# EAGLE design diplomat-modbus (EAGLE 7.7.0)
AUTHOR: Jan Nyman; REVISION: A
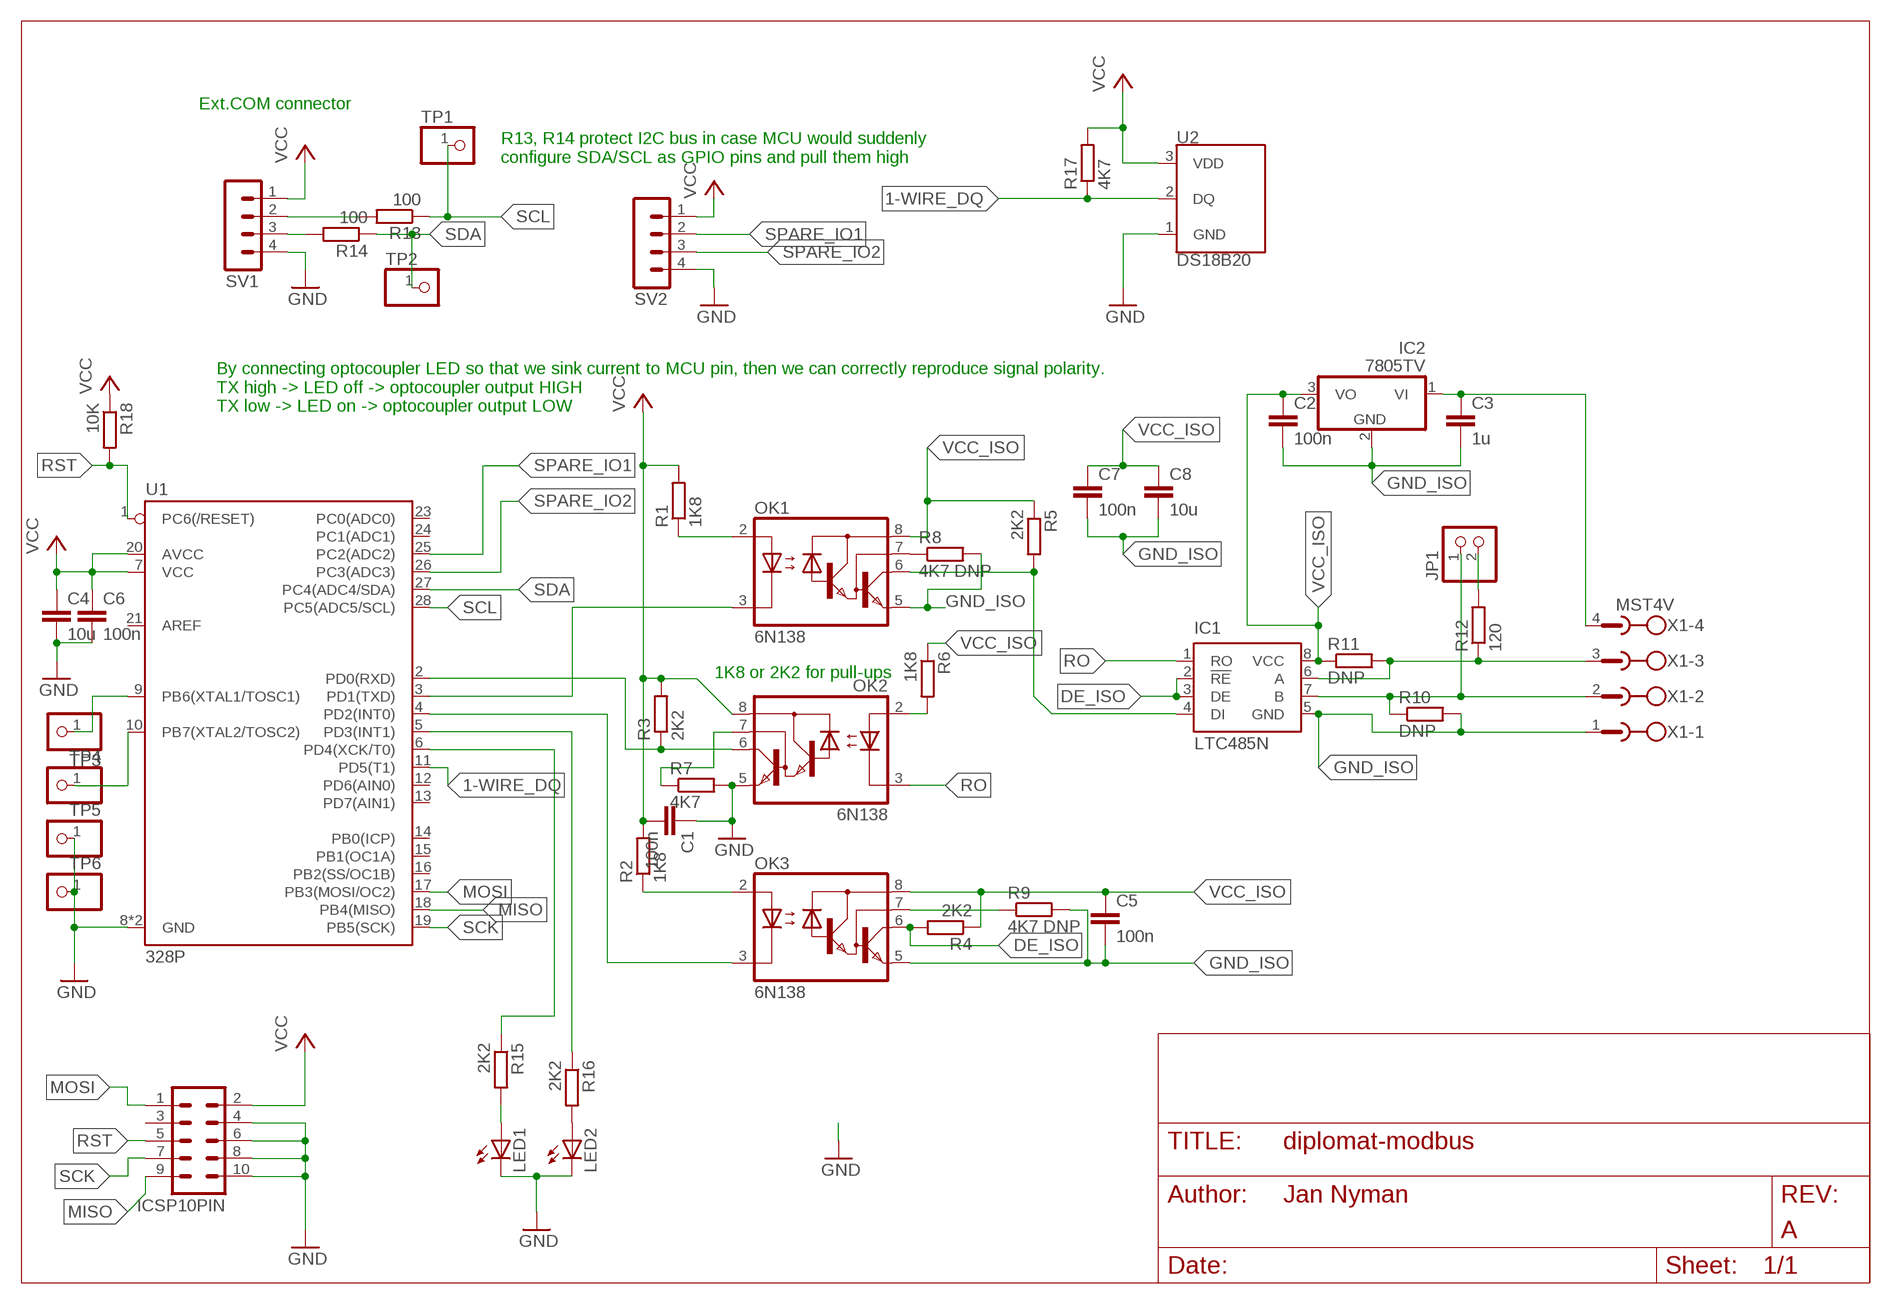
[diagram p0: schematic, sheet 1]

## Parts
C1  100n  C-EU025-024X044  [C025-024X044]
C2  100n  C-EU025-024X044  [C025-024X044]
C3  1u  C-EU025-024X044  [C025-024X044]
C4  10u  C-EU025-024X044  [C025-024X044]
C5  100n  C-EU025-024X044  [C025-024X044]
C6  100n  C-EU025-024X044  [C025-024X044]
C7  100n  C-EU025-024X044  [C025-024X044]
C8  10u  C-EU025-024X044  [C025-024X044]
IC1  LTC485N  [DIL08]
IC2  7805TV  [TO220V]
ICSP10PIN  MA05-2  [MA05-2]
JP1  PINHD-1X2  [1X02]
LED1  LED3MM  [LED3MM]
LED2  LED3MM  [LED3MM]
OK1  6N138  [DIL08]
OK2  6N138  [DIL08]
OK3  6N138  [DIL08]
R1  1K8  R-EU_0309/V  [0309V]
R2  1K8  R-EU_0309/V  [0309V]
R3  2K2  R-EU_0309/V  [0309V]
R4  2K2  R-EU_0309/V  [0309V]
R5  2K2  R-EU_0309/V  [0309V]
R6  1K8  R-EU_0309/V  [0309V]
R7  4K7  R-EU_0309/V  [0309V]
R8  4K7 DNP  R-EU_0309/V  [0309V]
R9  4K7 DNP  R-EU_0309/V  [0309V]
R10  DNP  R-EU_0309/V  [0309V]
R11  DNP  R-EU_0309/V  [0309V]
R12  120  R-EU_0309/V  [0309V]
R13  100  R-EU_0309/V  [0309V]
R14  100  R-EU_0309/V  [0309V]
R15  2K2  R-EU_0309/V  [0309V]
R16  2K2  R-EU_0309/V  [0309V]
R17  4K7  R-EU_0309/V  [0309V]
R18  10K  R-EU_0309/V  [0309V]
SV1  MA04-1  [MA04-1]
SV2  MA04-1  [MA04-1]
TP1  PINHD-1X1  [1X01]
TP2  PINHD-1X1  [1X01]
TP3  PINHD-1X1  [1X01]
TP4  PINHD-1X1  [1X01]
TP5  PINHD-1X1  [1X01]
TP6  PINHD-1X1  [1X01]
U1  328P  ATMEGA328P_PDIP  [DIP28]
U2  DS18B20  [TO-92-AMMO]
X1  MST4V  [MSTBV4]

## Nets
1-WIRE_DQ: R17.1 U1.11(PD5(T1)) U2.2(DQ)
DE_ISO: IC1.2(!RE) IC1.3(DE) OK3.6(VO) R4.2
GND [GND]: C1.1 C4.2 C6.2 ICSP10PIN.4 ICSP10PIN.6 ICSP10PIN.8 ICSP10PIN.10 LED1.K(C) LED2.K(C) OK2.5(GND) R7.2 SV1.4 SV2.4 TP5.1 TP6.1 U1.8(GND) U1.22(GND) U2.1(GND)
GND_ISO: C2.2 C3.2 C5.2 C7.2 C8.2 IC1.5(GND) IC2.2(GND) OK1.5(GND) OK3.5(GND) R8.2 R9.2 R10.2 X1.1
MISO: ICSP10PIN.9 U1.18(PB4(MISO))
MOSI: ICSP10PIN.1 U1.17(PB3(MOSI/OC2))
N$1: OK1.3(C) U1.3(PD1(TXD))
N$2: OK1.2(A) R1.1
N$3: OK3.2(A) R2.1
N$4: OK3.3(C) U1.4(PD2(INT0))
N$5: JP1.2 R12.2
N$6: IC1.4(DI) OK1.6(VO) R5.2
N$7: TP3.1 U1.9(PB6(XTAL1/TOSC1))
N$8: OK2.2(A) R6.2
N$9: IC1.7(B) JP1.1 R10.1 X1.2
N$10: IC1.6(A) R11.2 R12.1 X1.3
N$11: C3.1 IC2.1(VI) X1.4
N$12: OK2.7(VB) R7.1
N$13: OK1.7(VB) R8.1
N$14: R13.2 SV1.2
N$15: OK3.7(VB) R9.1
N$16: R15.1 U1.6(PD4(XCK/T0))
N$17: R16.1 U1.5(PD3(INT1))
N$18: LED1.A R15.2
N$19: LED2.A R16.2
N$20: TP4.1 U1.10(PB7(XTAL2/TOSC2))
RO: IC1.1(RO) OK2.3(C)
RST: ICSP10PIN.5 R18.2 U1.1(PC6(/RESET))
RX: OK2.6(VO) R3.1 U1.2(PD0(RXD))
SCK: ICSP10PIN.7 U1.19(PB5(SCK))
SCL: R13.1 TP1.1 U1.28(PC5(ADC5/SCL))
SDA: R14.1 TP2.1 U1.27(PC4(ADC4/SDA))
SPARE_IO1: SV2.2 U1.25(PC2(ADC2))
SPARE_IO2: SV2.3 U1.26(PC3(ADC3))
VCC [VCC]: C1.2 C4.1 C6.1 ICSP10PIN.2 OK2.8(VCC) R1.2 R2.2 R3.2 R17.2 R18.1 SV1.1 SV2.1 U1.7(VCC) U1.20(AVCC) U2.3(VDD)
VCC_ISO: C2.1 C5.1 C7.1 C8.1 IC1.8(VCC) IC2.3(VO) OK1.8(VCC) OK3.8(VCC) R4.1 R5.1 R6.1 R11.1
XXX: R14.2 SV1.3
Unconnected: ICSP10PIN.3 U1.12(PD6(AIN0)) U1.13(PD7(AIN1)) U1.14(PB0(ICP)) U1.15(PB1(OC1A)) U1.16(PB2(SS/OC1B)) U1.21(AREF) U1.23(PC0(ADC0)) U1.24(PC1(ADC1))

## Notes on the sheet
- Ext.COM connector
- R13, R14 protect I2C bus in case MCU would suddenly 
  configure SDA/SCL as GPIO pins and pull them high
- By connecting optocoupler LED so that we sink current to MCU pin, then we can correctly reproduce signal polarity.
  TX high -> LED off -> optocoupler output HIGH
  TX low -> LED on -> optocoupler output LOW
- 1K8 or 2K2 for pull-ups

## Library data of the parts
C1-C8 = resistor:C-EU: CAPACITOR, European symbol
IC1 = linear-technology:LTC485: Low Power RS485 Interface Transceiver Source: http://www.linear.com/pc/downloadDocument.do?navId=H0,C1,C1007,C1017,P2064,D1718; OC_FARNELL: unknown; OC_NEWARK: unknown
IC2 = linear:78*: Positive VOLTAGE REGULATOR Source: http://cache.national.com/ds/LM/LM78L05.pdf http://www.fairchildsemi.com/ds/LM/LM7805.pdf
ICSP10PIN = con-lstb:MA05-2: PIN HEADER; OC_FARNELL: unknown; OC_NEWARK: unknown
JP1 = pinhead:PINHD-1X2: PIN HEADER
LED1 LED2 = led:LED: LED OSRAM: - CHIPLED LG R971, LG N971, LY N971, LG Q971, LY Q971, LO R971, LY R971 LH N974, LH R974 LS Q976, LO Q976, LY Q976 LO Q996 - Hyper CHIPLED LW Q18S LB Q993, LB Q99A, LB R99A - SideLED LS A670, LO A670, LY A670, LG A670, LP A670 LB A673, LV A673, LT A673, LW A673 LH A674 LY A675 LS A676, LA A676, LO A676, LY A676, LW A676 LS A679, LY A679, LG A679 - Hyper Micro SIDELED® LS Y876, LA Y876, LO Y876, LY Y876 LT Y87S - SmartLED LW L88C, LW L88S LB L89C, LB L89S, LG L890 LS L89K, LO L89K, LY L89K LS L896, LA L896, LO L896, LY L896 - TOPLED LS T670, LO T670, LY T670, LG T670, LP T670 LSG T670, LSP T670, LSY T670, LOP T670, LYG T670 LG T671, LOG T671, LSG T671 LB T673, LV T673, LT T673, LW T673 LH T674 LS T676, LA T676, LO T676, LY T676, LB T676, LH T676, LSB T676, LW T676 LB T67C, LV T67C, LT T67C, LS T67K, LO T67K, LY T67K, LW E67C LS E67B, LA E67B, LO E67B, LY E67B, LB E67C, LV E67C, LT E67C LW T67C LS T679, LY T679, LG T679 LS T770, LO T770, LY T770, LG T770, LP T770 LB T773, LV T773, LT T773, LW T773 LH T774 LS E675, LA E675, LY E675, LS T675 LS T776, LA T776, LO T776, LY T776, LB T776 LHGB T686 LT T68C, LB T68C - Hyper Mini TOPLED® LB M676 - Mini TOPLED Santana® LG M470 LS M47K, LO M47K, LY M47K Source: http://www.osram.convergy.de LUXEON: - LUMILED® LXK2-PW12-R00, LXK2-PW12-S00, LXK2-PW14-U00, LXK2-PW14-V00 LXK2-PM12-R00, LXK2-PM12-S00, LXK2-PM14-U00 LXK2-PE12-Q00, LXK2-PE12-R00, LXK2-PE12-S00, LXK2-PE14-T00, LXK2-PE14-U00 LXK2-PB12-K00, LXK2-PB12-L00, LXK2-PB12-M00, LXK2-PB14-N00, LXK2-PB14-P00, LXK2-PB14-Q00 LXK2-PR12-L00, LXK2-PR12-M00, LXK2-PR14-Q00, LXK2-PR14-R00 LXK2-PD12-Q00, LXK2-PD12-R00, LXK2-PD12-S00 LXK2-PH12-R00, LXK2-PH12-S00 LXK2-PL12-P00, LXK2-PL12-Q00, LXK2-PL12-R00 Source: www.luxeon.com KINGBRIGHT: KA-3528ASYC Source: www.kingbright.com
OK1-OK3 = optocoupler:6N138: MOTOROLA OPTO COUPLER; MF: VISHAY/TELEFUNKEN; MPN: 6N138; OC_FARNELL: 9860150; OC_NEWARK: 35K5294
R1-R18 = resistor:R-EU_: RESISTOR, European symbol
SV1 SV2 = con-lstb:MA04-1: PIN HEADER; OC_FARNELL: unknown; OC_NEWARK: unknown
TP1-TP6 = pinhead:PINHD-1X1: PIN HEADER
U1 = SparkFun-IC-Microcontroller:ATMEGA328P_PDIP: Atmel 328P Through hole ATMEGA328P uC used in the Arduino 32kb flash, 1k EEPROM, 2k SRAM Datasheet <http://www.sparkfun.com/datasheets/Components/SMD/ATMega328.pdf> SparkFun Products Storefront component: AVR 28 Pin 20MHz 32K 6A/D - ATMega328P <https://www.sparkfun.com/products/9061> (COM-09061) SparkFun Simon Says - Through-Hole Soldering Kit <https://www.sparkfun.com/products/10547> (KIT-10547) SparkFun Learn to Solder - Simon Says <https://www.sparkfun.com/products/13708> (KIT-13708) SparkFun BigTime Watch Kit <https://www.sparkfun.com/products/11734> (KIT-11734) SparkFun ClockIt <https://www.sparkfun.com/products/10930> (KIT-10930) SparkFun Serial Enabled LCD Kit <https://www.sparkfun.com/products/10097> (LCD-10097) SparkFun Simon Tilts - Through Hole Soldering Kit <https://www.sparkfun.com/products/12634> (KIT-12634) SparkFun Frequency Counter Kit <https://www.sparkfun.com/products/10140> (KIT-10140) FabFM Radio Kit <https://www.sparkfun.com/products/11043> (KIT-11043) SparkFun Binary Blaster Kit <https://www.sparkfun.com/products/12037> (KIT-12037) SparkFun Metro-Gnome <https://www.sparkfun.com/products/9236> (KIT-09236) ATmega328 with Arduino Optiboot (Uno) <https://www.sparkfun.com/products/10524> (DEV-10524); PROD_ID: IC-09136
U2 = SparkFun-Sensors:DS18B20: Dallas/Maxim DS18B20 1-Wire Temperature Sensor The DS18B20 reports degrees C with 9 to 12-bit precision, -55C to 125C (+/-0.5C). Each sensor has a unique 64-Bit Serial number etched into it - allows for a huge number of sensors to be used on one data bus. Datasheet <http://datasheets.maximintegrated.com/en/ds/DS18B20.pdf> SparkFun Products One Wire Digital Temperature Sensor - DS18B20 <https://www.sparkfun.com/products/245> (SEN-00245); STORE_ID: SEN-00245
X1 = con-phoenix-508:MST4V: PHOENIX; OC_FARNELL: unknown; OC_NEWARK: unknown

## Net classes
0 default: width 0.406 mm
1 VCC: width 0.813 mm
2 GND: width 0.813 mm

## Board
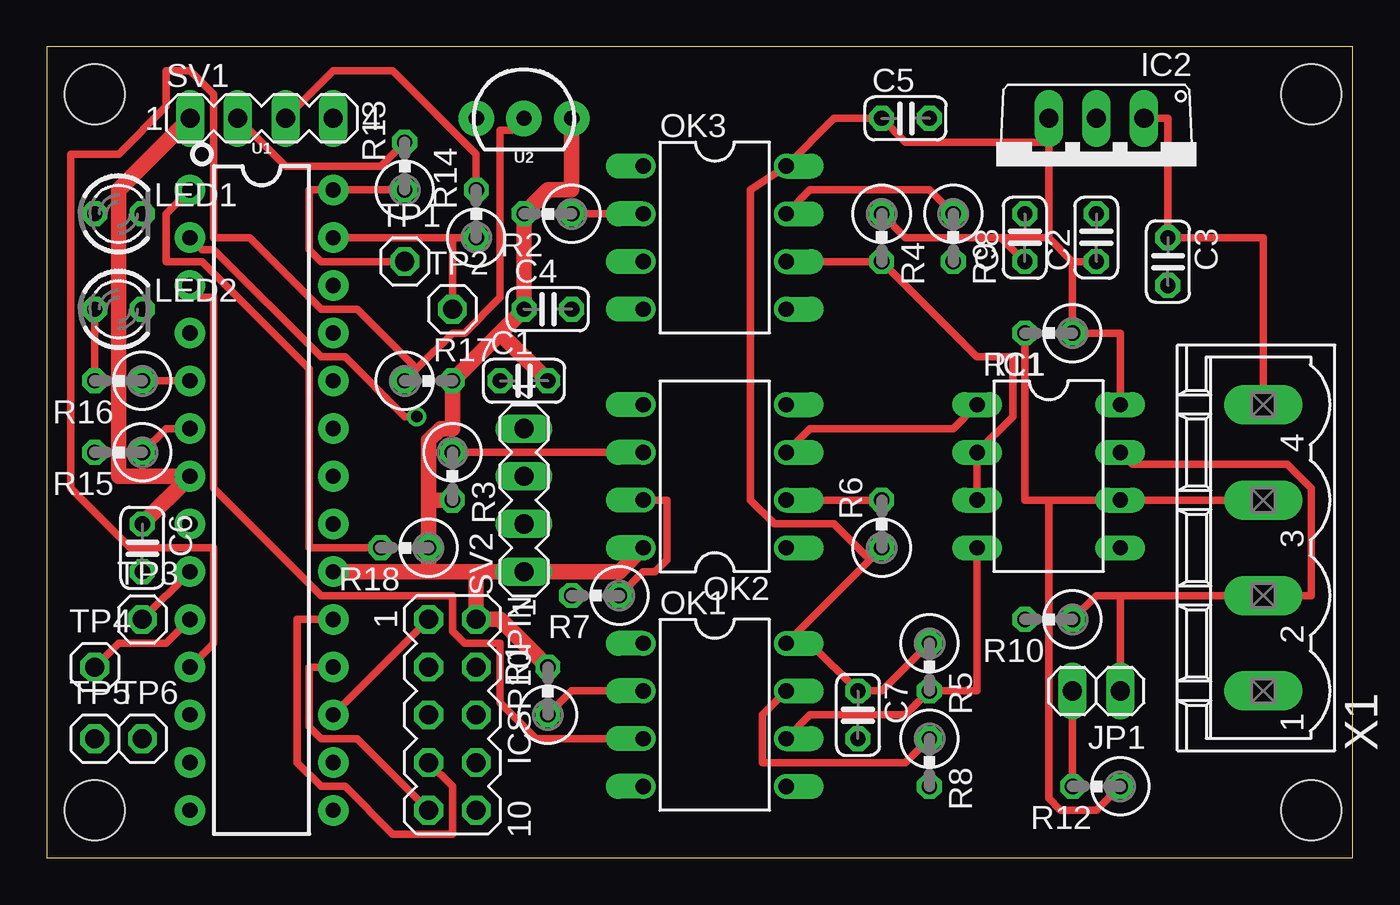
[diagram p1: board, top side]
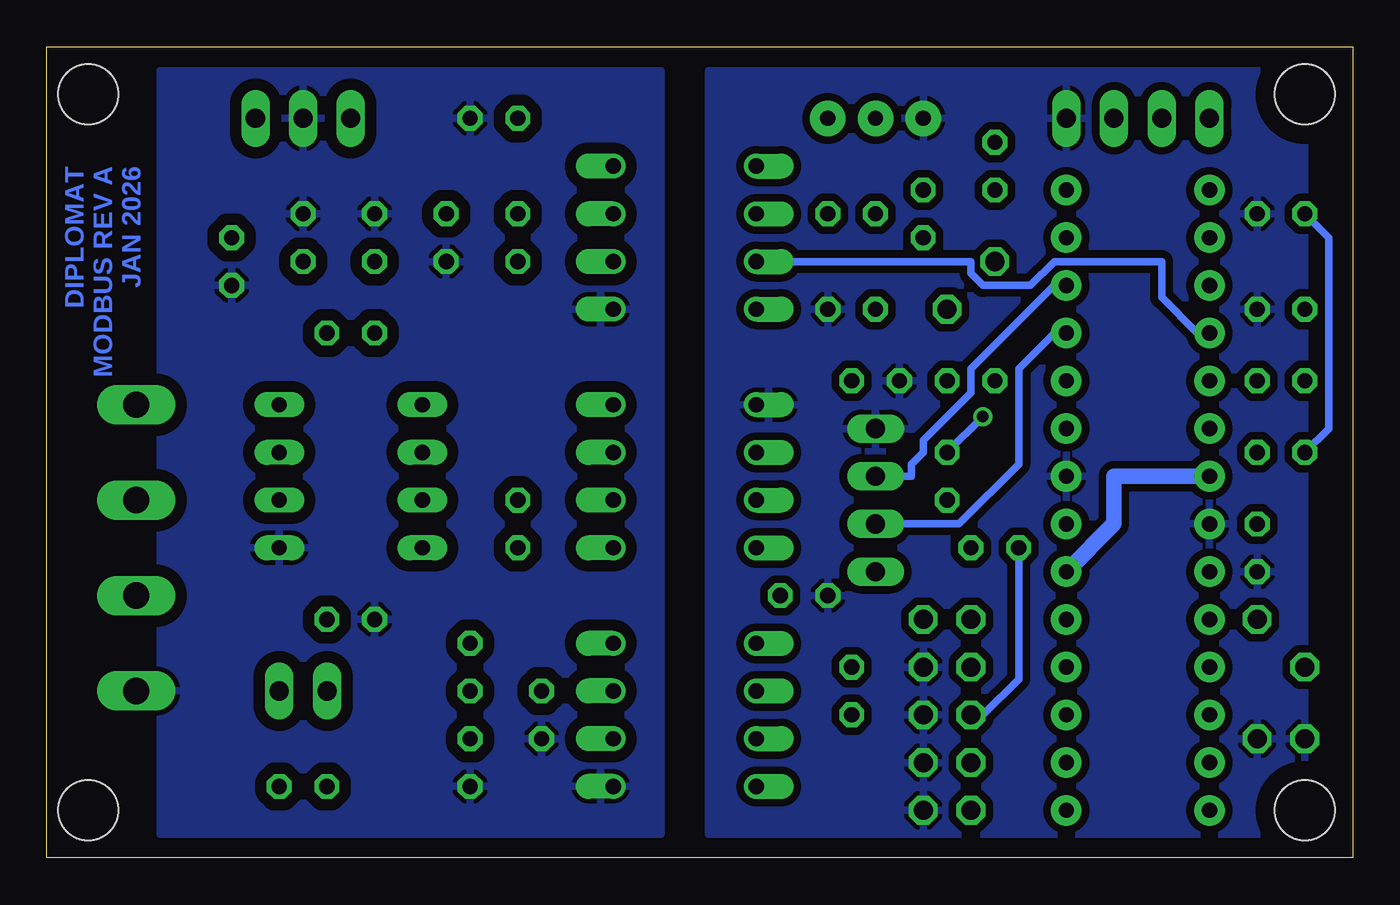
[diagram p2: board, bottom side, seen from below]

Size 69.52 x 43.17 mm. Coordinates in mm from the lower left corner, seen from the top.
Outline: 0,0 69.52,0 69.52,43.17 0,43.17 0,0
Copper layers (1*16): Top 0.035mm / dielectric 1.5mm / Bottom 0.035mm
Design rules "default *": minimum track width 10mil, minimum drill 24mil, track to track 8mil, track to pad 8mil, pad to pad 8mil, via to via 8mil, smd to smd 8mil, copper to edge 40mil, drill to drill 8mil, minimum pad ring 10mil, minimum via ring 8mil, stop-mask expansion 4mil, vias tented up to drill 0mil, thermal gap 10mil
Holes 3.2 mm at 2.54,2.54 2.54,40.64 67.31,2.54 67.31,40.64

### Footprints (pad centres in the part's own frame; a part is rotated, then mirrored left to right if it is on the bottom)
C025-024X044 = drill 0.813 octagon: 1 -1.27,0; 2 1.27,0
DIL08 = drill 0.813 long: 1 -3.81,-3.81; 2 -1.27,-3.81; 3 1.27,-3.81; 4 3.81,-3.81; 5 3.81,3.81; 6 1.27,3.81; 7 -1.27,3.81; 8 -3.81,3.81
TO220V = drill 1.016 long: 1 -2.54,-2.54; 2 0,-2.54; 3 2.54,-2.54
MA05-2 = drill 1.016 octagon: 1 -5.08,-1.27; 2 -5.08,1.27; 3 -2.54,-1.27; 4 -2.54,1.27; 5 0,-1.27; 6 0,1.27; 7 2.54,-1.27; 8 2.54,1.27; 9 5.08,-1.27; 10 5.08,1.27
1X02 = drill 1.016 long: 1 -1.27,0; 2 1.27,0
LED3MM = drill 0.813 octagon: A -1.27,0; K 1.27,0
DIL08' = drill 0.813 offset: 1 -3.81,-3.81; 2 -1.27,-3.81; 3 1.27,-3.81; 4 3.81,-3.81; 5 3.81,3.81; 6 1.27,3.81; 7 -1.27,3.81; 8 -3.81,3.81
0309V = drill 0.813 octagon: 1 -1.27,0; 2 1.27,0
MA04-1 = drill 1.016 long: 1 -3.81,0; 2 -1.27,0; 3 1.27,0; 4 3.81,0
1X01 = drill 1.016 octagon: 1 0,0
DIP28 = drill 0.813 pad 1.626: 1 -16.51,-3.81; 2 -13.97,-3.81; 3 -11.43,-3.81; 4 -8.89,-3.81; 5 -6.35,-3.81; 6 -3.81,-3.81; 7 -1.27,-3.81; 8 1.27,-3.81; 9 3.81,-3.81; 10 6.35,-3.81; 11 8.89,-3.81; 12 11.43,-3.81; 13 13.97,-3.81; 14 16.51,-3.81; 15 16.51,3.81; 16 13.97,3.81; 17 11.43,3.81; 18 8.89,3.81; 19 6.35,3.81; 20 3.81,3.81; 21 1.27,3.81; 22 -1.27,3.81; 23 -3.81,3.81; 24 -6.35,3.81; 25 -8.89,3.81; 26 -11.43,3.81; 27 -13.97,3.81; 28 -16.51,3.81
TO-92-AMMO = drill 0.813 pad 1.88: 1 -2.54,0; 2 0,0; 3 2.54,0
MSTBV4 = drill 1.397 long: 1 -7.62,0; 2 -2.54,0; 3 2.54,0; 4 7.62,0

### Placement (x,y rotation side)
C1  25.4,25.4 0 top
C2  55.88,33.02 90 top
C3  59.69,31.75 270 top
C4  26.67,29.21 0 top
C5  45.72,39.37 0 top
C6  5.08,16.51 270 top
C7  43.18,7.62 270 top
C8  52.07,33.02 90 top
IC1  53.34,20.32 270 top
IC2  55.88,36.83 180 top
ICSP10PIN  21.59,7.62 270 top
JP1  55.88,8.89 180 top
LED1  3.81,34.29 0 top
LED2  3.81,29.21 0 top
OK1  6N138  [DIL08']  35.56,7.62 270 top
OK2  6N138  [DIL08']  35.56,20.32 90 top
OK3  6N138  [DIL08']  35.56,33.02 270 top
R1  26.67,8.89 90 top
R2  26.67,34.29 180 top
R3  21.59,20.32 270 top
R4  44.45,33.02 270 top
R5  46.99,10.16 270 top
R6  44.45,17.78 90 top
R7  29.21,13.97 180 top
R8  46.99,5.08 270 top
R9  48.26,33.02 270 top
R10  53.34,12.7 180 top
R11  53.34,27.94 180 top
R12  55.88,3.81 180 top
R13  19.05,36.83 90 top
R14  22.86,34.29 90 top
R15  3.81,21.59 180 top
R16  3.81,25.4 180 top
R17  20.32,25.4 0 top
R18  19.05,16.51 180 top
SV1  11.43,39.37 0 top
SV2  25.4,19.05 90 top
TP1  19.05,31.75 0 top
TP2  21.59,29.21 0 top
TP3  5.08,12.7 0 top
TP4  2.54,10.16 0 top
TP5  2.54,6.35 0 top
TP6  5.08,6.35 0 top
U1  11.43,19.05 270 top
U2  25.4,39.37 0 top
X1  64.77,16.51 90 top

### Tracks (layer width: path | path; a pad name or v marks a point on that pad's centre or on a via)
1-WIRE_DQ
  Top 0.406: 19.68,26.04 21.59,27.94 22.23,27.94 24.13,29.84 24.13,38.73 24.77,38.73 U2.2 | 19.68,26.04 R17.1 | U1.11 8.89,11.43 8.89,16.51 4.45,16.51 1.27,19.68 1.27,37.47 3.81,37.47 6.35,40.01 6.35,41.91 7.62,41.91 8.89,40.64 8.89,33.02 10.79,33.02 14.61,29.21 16.51,29.21 19.68,26.04
DE_ISO
  Top 0.406: IC1.3 IC1.2 51.44,23.5 51.44,26.67 49.53,26.67 R4.2 OK3.6
GND
  pour Bottom (isolate 0.406): 2.54,41.91 2.54,1.27 34.29,1.27 34.29,41.91
GND_ISO
  pour Bottom (isolate 0.61): 36.83,41.91 36.83,1.27 63.5,1.27 63.5,41.91
MISO
  Top 0.406: ICSP10PIN.9 16.51,6.35 14.61,6.35 13.97,6.99 13.97,10.16 U1.18
MOSI
  Top 0.406: U1.17 ICSP10PIN.1
N$1
  Top 0.406: OK1.3 26.04,6.35 24.13,8.26 24.13,11.43 22.23,11.43 21.59,12.06 21.59,13.97 14.61,13.97 8.89,19.68 8.89,29.84 8.26,29.84 U1.3
N$2
  Top 0.406: R1.1 27.94,8.89 OK1.2
N$3
  Top 0.406: OK3.2 R2.1
N$4
  Bottom 0.406: OK3.3 20.32,31.75 20.32,31.11 19.68,30.48 17.14,30.48 15.88,31.75 10.16,31.75 10.16,29.84 8.26,27.94 U1.4
N$5
  Top 0.406: JP1.2 R12.2
N$6
  Top 0.406: OK1.6 40.64,7.62 45.72,7.62 R5.2 49.53,8.89 IC1.4
N$7
  Top 0.406: U1.9 TP3.1
N$8
  Top 0.406: R6.2 OK2.2
N$9
  Top 0.406: R10.1 55.88,13.97 57.15,13.97 | 57.15,13.97 X1.2 67.31,13.97 67.31,19.68 66.04,20.95 57.78,20.95 IC1.7 | 57.15,13.97 JP1.1
N$10
  Top 0.406: R12.1 55.88,2.54 53.98,2.54 53.34,3.17 53.34,19.05 | 53.34,19.05 IC1.6 X1.3 | R11.2 52.07,19.05 53.34,19.05
N$11
  Top 0.406: IC2.1 59.69,39.37 C3.1 64.77,33.02 X1.4
N$12
  Top 0.406: R7.1 31.75,15.24 32.38,15.24 33.02,15.88 33.02,19.05 OK2.7
N$13
  Top 0.406: OK1.7 38.1,7.62 38.1,5.08 45.72,5.08 R8.1
N$14
  Top 0.406: R13.2 17.78,36.83 12.7,36.83 SV1.2
N$15
  Top 0.406: OK3.7 40.64,35.56 46.99,35.56 R9.1
N$16
  Top 0.406: R15.1 6.35,22.86 U1.6
N$17
  Top 0.406: U1.5 R16.1
N$18
  Bottom 0.406: R15.2 1.27,22.86 1.27,33.02 LED1.A
N$19
  Top 0.406: LED2.A R16.2
N$20
  Top 0.406: TP4.1 3.81,11.43 6.35,11.43 U1.10
RO
  Top 0.406: OK2.3 40.64,22.86 48.26,22.86 IC1.1
RST
  Top 0.406: U1.1 6.35,34.29 6.35,31.75 8.26,31.75 13.97,26.04 13.97,16.51 R18.2
  Bottom 0.406: R18.2 17.78,9.53 19.68,7.62 ICSP10PIN.5
RX  (via drill 0.61)
  Top 0.406: OK2.6 R3.1 | U1.2 8.26,32.38 8.89,32.38 14.61,26.67 15.88,26.67 19.05,23.5 v19.68,23.5
  Bottom 0.406: R3.1 v19.68,23.5
SCK
  Top 0.406: ICSP10PIN.7 21.59,3.81 21.59,1.27 18.41,1.27 15.88,3.81 14.61,3.81 13.34,5.08 13.34,12.7 U1.19
SCL
  Top 0.406: R13.1 U1.28 13.97,35.56 13.97,32.38 14.61,31.75 TP1.1
SDA
  Top 0.406: U1.27 21.59,33.02 | 21.59,33.02 R14.1 | 21.59,33.02 TP2.1
SPARE_IO1
  Bottom 0.406: SV2.2 20.95,17.78 17.78,20.95 17.78,26.04 15.88,27.94 U1.25
SPARE_IO2
  Bottom 0.406: SV2.3 23.5,20.32 23.5,20.95 22.86,21.59 22.86,22.23 20.32,24.77 20.32,26.04 15.88,30.48 U1.26
VCC
  Top 0.813: C6.1 U1.7 3.81,20.32 3.81,35.56 SV1.1 | 24.13,27.94 C4.1 R2.2 26.67,35.56 27.94,35.56 U2.3 | 24.13,27.94 R17.2 21.59,22.86 20.95,22.86 20.32,22.23 20.32,19.05 | 24.13,27.94 C1.2 | R1.2 24.13,12.7 ICSP10PIN.2 22.86,15.24 | 20.32,19.05 R18.1 20.32,15.24 | R3.2 20.32,19.05 | OK2.8 30.48,15.24 SV2.1 22.86,15.24 | 22.86,15.24 20.32,15.24 | 20.32,15.24 U1.20
  Bottom 0.813: U1.7 12.7,20.32 12.7,17.78 U1.20
VCC_ISO
  Top 0.406: 43.81,15.88 OK1.8 40.64,11.43 C7.1 44.45,8.89 R5.1 | 43.81,15.88 R6.1 | 54.61,31.75 R11.1 57.15,27.94 IC1.8 | C2.1 54.61,31.75 | R4.1 45.72,33.02 50.8,33.02 | C8.1 50.8,33.02 | 53.34,33.02 53.34,38.1 | 50.8,33.02 53.34,33.02 | 53.34,38.1 45.72,38.1 C5.1 41.91,39.37 OK3.8 37.47,35.56 37.47,19.05 38.73,17.78 41.91,17.78 43.81,15.88 | 53.34,38.1 IC2.3 | 53.34,33.02 54.61,31.75
XXX
  Top 0.406: R14.2 22.86,37.47 18.41,41.91 15.24,41.91 SV1.3

### Text on the board
Bottom: DIPLOMAT / MODBUS REV A / JAN 2026